# Altium schematic sheet Microcontroller.SchDoc
size 420 x 297 mm
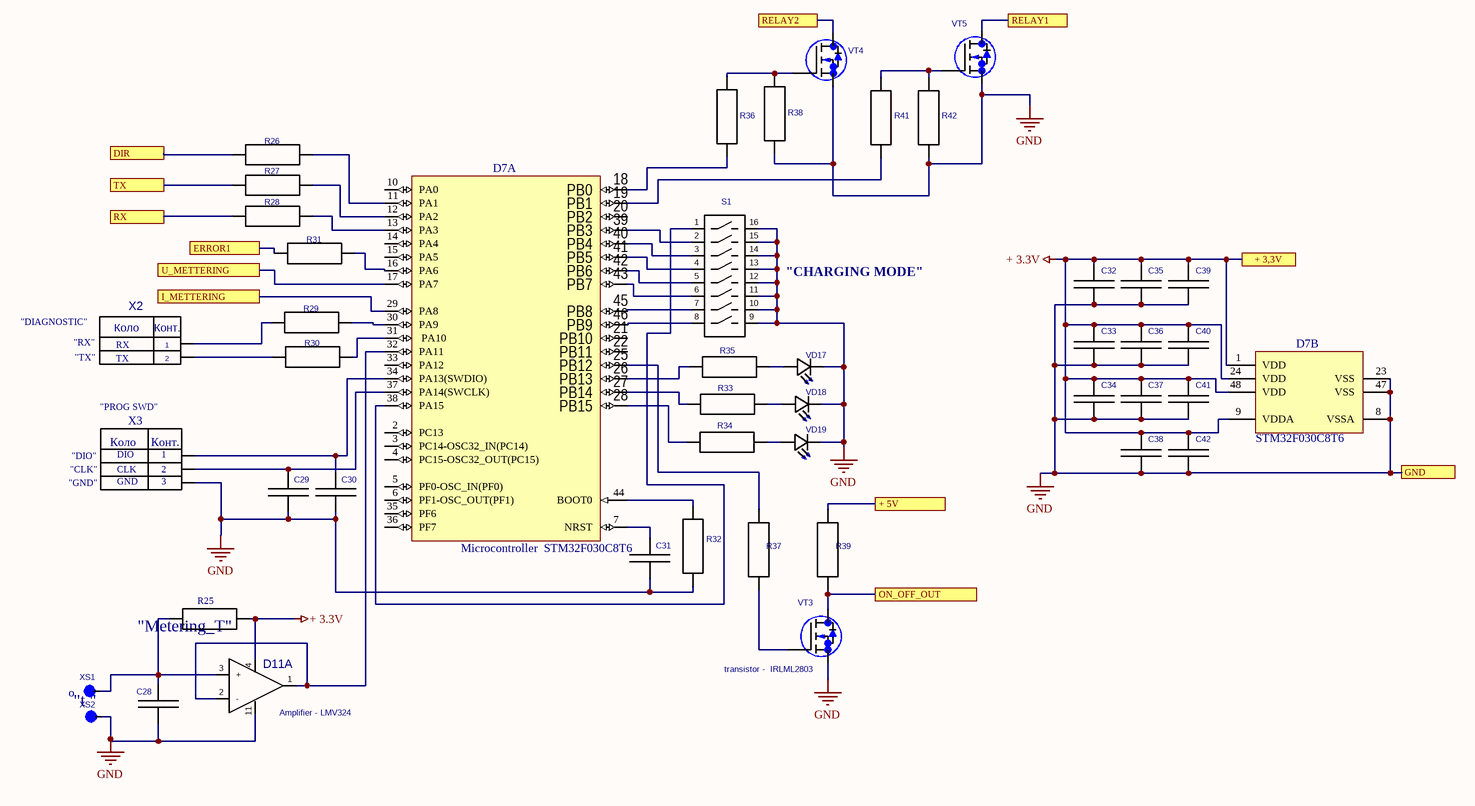
[diagram p0: Microcontroller.SchDoc]

## Parts
C28  Ceramic Capacitor- GRM21BR71H104KA01  [CAP-0805]  (value not drawn)
C29  Ceramic Capacitor -GRM2165C1H270JZ01D  [CAP-0805]  (value not drawn)
C30  Ceramic Capacitor -GRM2165C1H270JZ01D  [CAP-0805]  (value not drawn)
C31  Ceramic Capacitor- GRM21BR71H104KA01  [CAP-0805]  (value not drawn)
C32  Ceramic Capacitor  - GRM219C71E475KE21L  [CAP-0805]  (value not drawn)
C33  Ceramic Capacitor  - GRM219C71E475KE21L  [CAP-0805]  (value not drawn)
C34  Ceramic Capacitor  - GRM219C71E475KE21L  [CAP-0805]  (value not drawn)
C35  Ceramic Capacitor- GRM21BR71H104KA01  [CAP-0805]  (value not drawn)
C36  Ceramic Capacitor- GRM21BR71H104KA01  [CAP-0805]  (value not drawn)
C37  Ceramic Capacitor- GRM21BR71H104KA01  [CAP-0805]  (value not drawn)
C38  CC0805  [CAP-0805]  (value not drawn)
C39  Ceramic Capacitor- GRM21BR71H104KA01  [CAP-0805]  (value not drawn)
C40  Ceramic Capacitor- GRM21BR71H104KA01  [CAP-0805]  (value not drawn)
C41  Ceramic Capacitor- GRM21BR71H104KA01  [CAP-0805]  (value not drawn)
C42  CC0805  [CAP-0805]  (value not drawn)
D7  Microcontroller  STM32F030C8T6  [48-LQFP]  (parts A,B of 2)
D11  Amplifier - LMV324  [14-SOIC]  (part A of 4)
R25  0805WAJ0153T10  [RES-0805]  (value not drawn)
R26  Resistor 0805  [RES-0805]  (value not drawn)
R27  Resistor 0805  [RES-0805]  (value not drawn)
R28  Resistor 0805  [RES-0805]  (value not drawn)
R29  Resistor 0805  [RES-0805]  (value not drawn)
R30  Resistor 0805  [RES-0805]  (value not drawn)
R31  Resistor 0805  [RES-0805]  (value not drawn)
R32  Resistor 0805  [RES-0805]  (value not drawn)
R33  Resistor 0805  [RES-0805]  (value not drawn)
R34  Resistor 0805  [RES-0805]  (value not drawn)
R35  Resistor 0805  [RES-0805]  (value not drawn)
R36  Resistor 0805  [RES-0805]  (value not drawn)
R37  Resistor 0805  [RES-0805]  (value not drawn)
R38  Resistor 0805  [RES-0805]  (value not drawn)
R39  Resistor 0805  [RES-0805]  (value not drawn)
R41  Resistor 0805  [RES-0805]  (value not drawn)
R42  Resistor 0805  [RES-0805]  (value not drawn)
S1  SMD_Switcher  [DIP16]  (value not drawn)
VD17  LED 0805  [RC0805]  (value not drawn)
VD18  LED 0805  [RC0805]  (value not drawn)
VD19  LED 0805  [RC0805]  (value not drawn)
VT3  transistor -  IRLML2803  [SOT-23A]
VT4  Transistor  IRLML2803  [SOT-23A]  (value not drawn)
VT5  Transistor  IRLML2803  [SOT-23A]  (value not drawn)
X2  Terminal Block - 15EDGRC-2.5-02P-14-00L(H)  [CON-DG308-2.54-02P]  (value not drawn)
X3  PLS-3  [CON-PLS-3]  (value not drawn)
XS1  CON1LEP  [CON1LEP]  (value not drawn)
XS2  CON1LEP  [CON1LEP]  (value not drawn)

## Ports
+ 3,3V, + 5V, DIR, ERROR1, GND, I_METTERING, ON_OFF_OUT, RELAY1, RELAY2, RX, TX, U_METTERING

## Nets
+ 3.3V: C32.2 C33.2 C34.2 C35.2 C36.2 C37.2 C38.2 C39.2 C40.2 C41.2 C42.2 D7.1(VDD) D7.9(VDDA) D7.24(VDD) D7.48(VDD) D11.4 R25.2 ; port + 3,3V
GND: C28.1 C29.1 C30.1 C31.1 C32.1 C33.1 C34.1 C35.1 C36.1 C37.1 C38.1 C39.1 C40.1 C41.1 C42.1 D7.8(VSSA) D7.23(VSS) D7.47(VSS) D11.11 R32.2 R38.2 R42.2 S1.9 S1.10 S1.11 S1.12 S1.13 S1.14 S1.15 S1.16 VD17.2 VD18.2 VD19.2 VT3.2(S) VT4.2(S) VT5.2(S) X3.3 XS2.1 ; port GND
+ 5V: R39.1 ; port + 5V
DIR: R26.2 ; port DIR
ERROR1: R31.2 ; port ERROR1
I_METTERING: D7.29(PA8) ; port I_METTERING
ON_OFF_OUT: R39.2 VT3.3(D) ; port ON_OFF_OUT
RELAY1: VT5.3(D) ; port RELAY1
RELAY2: VT4.3(D) ; port RELAY2
RX: R28.2 ; port RX
TX: R27.2 ; port TX
U_METTERING: D7.17(PA7) ; port U_METTERING
NetC28_2: C28.2 D11.3(+) R25.1 XS1.1
NetC29_2: C29.2 D7.37(PA14(SWCLK)) X3.2
NetC30_2: C30.2 D7.34(PA13(SWDIO)) X3.1
NetC31_2: C31.2 D7.7(NRST)
NetD7_11: D7.11(PA1) R26.1
NetD7_12: D7.12(PA2) R27.1
NetD7_13: D7.13(PA3) R28.1
NetD7_16: D7.16(PA6) R31.1
NetD7_18: D7.18(PB0) R36.2
NetD7_19: D7.19(PB1) R41.2
NetD7_25: D7.25(PB12) R37.1
NetD7_26: D7.26(PB13) R35.2
NetD7_27: D7.27(PB14) R33.2
NetD7_28: D7.28(PB15) R34.2
NetD7_30: D7.30(PA9) R29.1
NetD7_31: D7.31(PA10) R30.1
NetD7_32: D7.32(PA11) D11.1 D11.2(-)
NetD7_38: D7.38(PA15) S1.1
NetD7_39: D7.39(PB3) S1.2
NetD7_40: D7.40(PB4) S1.3
NetD7_41: D7.41(PB5) S1.4
NetD7_42: D7.42(PB6) S1.5
NetD7_43: D7.43(PB7) S1.6
NetD7_44: D7.44(BOOT0) R32.1
NetD7_45: D7.45(PB8) S1.7
NetD7_46: D7.46(PB9) S1.8
NetR29_2: R29.2 X2.1
NetR30_2: R30.2 X2.2
NetR33_1: R33.1 VD18.1
NetR34_1: R34.1 VD19.1
NetR35_1: R35.1 VD17.1
NetR36_1: R36.1 R38.1 VT4.1(G)
NetR37_2: R37.2 VT3.1(G)
NetR41_1: R41.1 R42.1 VT5.1(G)

Not connected (* = marked no-connect by the designer): D7 2(PC13) 3(PC14-OSC32_IN(PC14)) 4(PC15-OSC32_OUT(PC15)) 5(PF0-OSC_IN(PF0)) 6(PF1-OSC_OUT(PF1)) 10(PA0) 14(PA4) 15(PA5) 20(PB2) 21(PB10) 22(PB11) 33(PA12) 35(PF6) 36(PF7)

## Notes on the sheet
- (near S1) "CHARGING MODE"
- "DIAGNOSTIC"
- "RX"
- RX
- "TX"
- "PROG SWD"
- TX
- "GND"
- "CLK"
- "DIO"
- (near X3) GND
- (near X3) CLK
- (near X3) DIO
- (near X3) 3
- (near X3) 2
- (near X3) 1
- "Metering_T"
- o
- "t "
- Відповідальна організація
- Технічне узгодження
- Розробник документу
- Вид документу
- Назва, додаткова назва
- Проєкт
- Документ затверджено
- Версія
- Дата видання
- Форм.
- Аркуш
- (in symbol DG301S-5.0-02P) Коло; Конт.
- (in symbol PLS3_ukr) Коло; Конт.

## Library data of the parts
C28 C31 C35-C37 C39-C41 = CC0805: Ceramic Capacitor- GRM21BR71H104KA01, 0.1 µF ±10% 50V  X7R 0805 (2012 Metric); Value: GRM21BR71H104KA01
  C28 C31 C35 C39: ComponentLink1Description: on digikey; ComponentLink1URL: https://www.digikey.si/en/products/detail/murata-electronics/GRM21BR71H104KA01L/586718
C29 C30 = CC0805: Ceramic Capacitor -GRM2165C1H270JZ01D, / 27 pF ±5% 50V C0G, NP0 0805 (2012 Metric); Value: GRM2165C1H270JZ01D; ComponentLink1Description: on digikey; ComponentLink1URL: https://www.digikey.si/en/products/detail/murata-electronics/GRM2165C1H270JZ01D/2612651
C32-C34 = CC0805: Ceramic Capacitor  - GRM219C71E475KE21L, / 4.7 µF ±10% 25V X7S 0805 (2012 Metric) /; Value: GRM219C71E475KE21L
  C32: ComponentLink1Description: on digikey; ComponentLink1URL: https://www.digikey.si/en/products/detail/murata-electronics/GRM219C71E475KE21L/8323859
C38 = CC0805: GRM21BR71H105KA01; Value: GRM21BR71H105KA01
C42 = CC0805: GRM21BR71H103KA01; Value: GRM21BR71H103KA01
D7 = STM32F030C8T6: Microcontroller STM32F030C8T6,ARM Cortex-M0, 32-bit MCU, 64 KB Flash, 8 KB Internal RAM, 39 I/Os, 48-pin LQFP, -40 to 85 degC, Tray /; FLASH Size (Prog) (kB): 64; I/Os (High Current): 39; Internal RAM Size (kB): 8; Operating Frequency(F) (Processor speed) (MHz): 48; Supply Voltage(Vcc) min (V): 2.4; DatasheetVersion: Rev. 1; PackageVersion: Rev. 6, 06/2013; PackageReference: LQFP48; PackageDescription: 48-Pin Low Profile Quad Flat Package, 7 x 7 mm Body, 0.5 mm Pitch; Supplier 1: Digi-Key; Supplier Part Number 1: 497-14043-ND; Supplier 2: Newark; Supplier Part Number 2: 06X3647; Supplier 3: Mouser; Supplier Part Number 3: 511-STM32F030C8T6; Core: ARM Cortex-M0; Packing: Tray; Mounting Technology: Surface Mount; ComponentLink1Description: Manufacturer URL; ComponentLink1URL: http://www.st.com/web/en/home.html; ComponentLink2Description: Datasheet; ComponentLink2URL: http://www.st.com/st-web-ui/static/active/en/resource/technical/document/datasheet/DM00088500.pdf; ComponentLink3Description: Package Specification; ComponentLink3URL: http://www.st.com/st-web-ui/static/active/en/resource/technical/document/datasheet/DM00058181.pdf; Value: STM32F030C8T6; ComponentLink4Description: on digikey; ComponentLink4URL: https://www.digikey.si/en/products/detail/stmicroelectronics/STM32F030C8T6/4357252
D11 = MC34074D: General Purpose Amplifier - LMV324, 4 Circuit Rail-to-Rail, SOIC-14 /; Value: LMV324; ComponentLink1Description: on digikey; ComponentLink1URL: https://www.digikey.si/en/products/detail/texas-instruments/LMV324AIDR/9674909
R25 = R0805_IPC: Resistor, 0805, 15 kOhm, 0805S8J0153T5E; PartName: Резистор; Note: ROYALOHM; Value: 0805S8J0153T5E
R26-R32 = R0805MY: Resistor 0805, 510 Ohm, 5% 0805S8J0511T5E; Value: 0805S8J0511T5E
R33-R39 R41 R42 = RC0805: Resistor 0805, 510 Ohm, 5% 0805S8J0511T5E; Value: 0805S8J0511T5E
S1 = SDIP16: SMD_Switcher, DSHP08TSGET, 8-pins; Value: DSHP08TSGET
VD17 = KP-2012SURK: Led, FYLS-0805HD, червоний.; Value: FYLS-0805HD
VD18 = KP-2012SURK: Led, FYLS-0805PGC, Зелений.; Value: FYLS-0805HD
VD19 = KP-2012SURK: Led, FYLS-0805BUWC, Білий.; Value: FYLS-0805BUWC
VT3 = IRLML2803: N-Channel Enhancement-Mode MOSFET (TMOS), IRLML2803, 30V; 1.2A; 0.4W; SOT23; Value: IRLML2803TRPBF; ComponentLink1Description: on digikey; ComponentLink1URL: https://www.digikey.si/en/products/detail/infineon-technologies/IRLML2803TRPBF/811435
VT4 VT5 = IRLML2803: N-Channel Enhancement-Mode MOSFET (TMOS), IRLML2803, 30V; 1.2A; 0.4W; SOT23; Value: IRLML2803; ComponentLink1Description: on digikey; ComponentLink1URL: https://www.digikey.si/en/products/detail/infineon-technologies/IRLML2803TRPBF/811435
X2 = DG301S-5.0-02P: Terminal Block - Terminal Block - 15EDGRC-2.5-02P-14-00L(H), 2 Position  Header, Male Pins, 2.5mm; Value: 15EDGRC-2.5-02P-14-00L(H)
X3 = PLS3_ukr: PLS-40-BLACK, Планка штирьова на плату пряма, крок 2,54мм 1x40 контакт. Колір: чорний. Контакты 6 и 3 мм; Value: PLS-40 BLACK; ComponentLink1Description: on kosmodrom; ComponentLink1URL: http://www.kosmodrom.com.ua/prodlist.php?name=PLS-40&page=0
XS1 XS2 = CON1LEP: PDIF_TY: 11100; PDIF_I_PID: XT1; Value: *